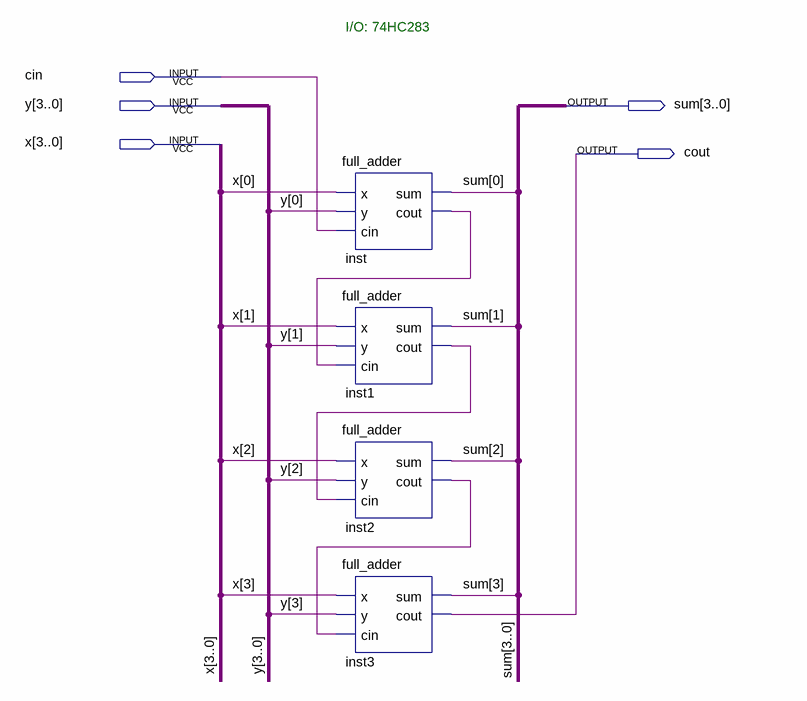
[diagram p0: schematic sheet]
// Quartus schematic fadderw4.bdf as structural Verilog: 4 symbols, 5 pins
module fadderw4 (
  input  cin,
  input  [3:0] y,
  input  [3:0] x,
  output [3:0] sum,
  output cout
);

  wire inst1_cout, inst2_cout, inst_cout;

  full_adder inst (.x(x[0]), .y(y[0]), .cin(cin), .sum(sum[0]), .cout(inst_cout));
  full_adder inst1 (.x(x[1]), .y(y[1]), .cin(inst_cout), .sum(sum[1]), .cout(inst1_cout));
  full_adder inst2 (.x(x[2]), .y(y[2]), .cin(inst1_cout), .sum(sum[2]), .cout(inst2_cout));
  full_adder inst3 (.x(x[3]), .y(y[3]), .cin(inst2_cout), .sum(sum[3]), .cout(cout));

  // Notes on the sheet:
  //   I/O: 74HC283
endmodule
